# Altium project Main_board3.PrjPcb
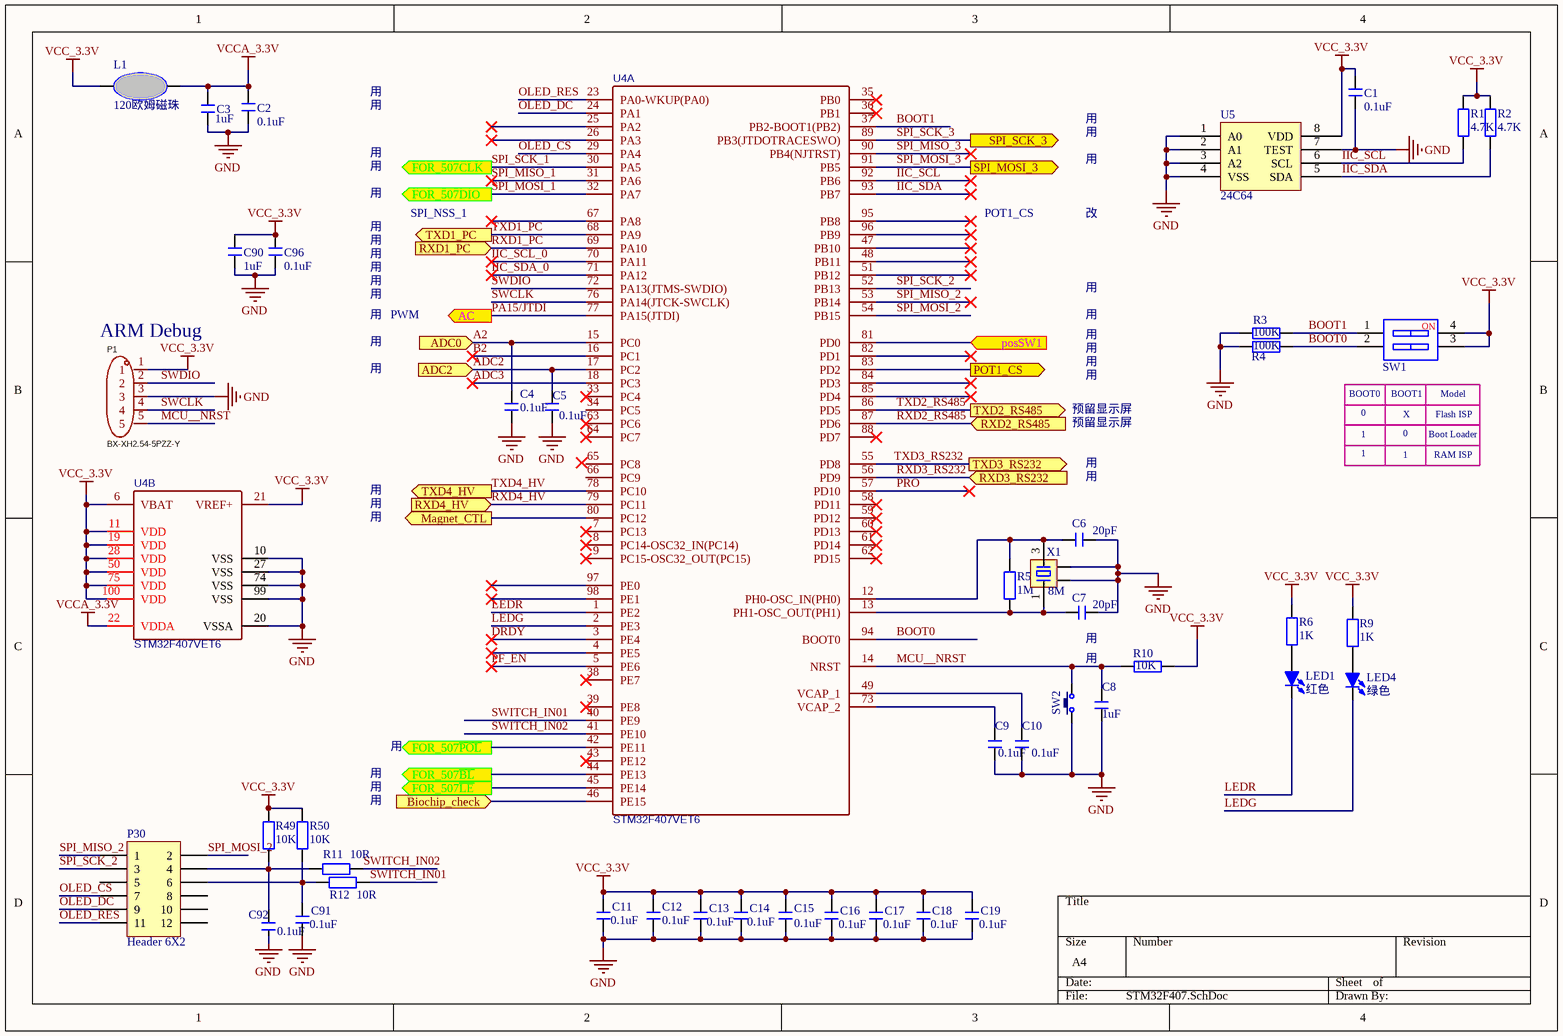
[diagram p0: STM32F407.SchDoc]
2 sheets, 64 parts. Net scope: flat (ports and power ports of the same name join across sheets).
Board file: BD3_yd_V1.0.PcbDoc
Sheets:
  STM32F407.SchDoc
  Connect.SchDoc

## Sheet STM32F407.SchDoc
size A4

### Parts
C1  0.1uF  [C 0603]
C2  0.1uF  [C 0603]
C3  1uF  [C 0603]
C4  0.1uF  [C 0603]
C5  0.1uF  [C 0603]
C6  20pF  [C 0603]
C7  20pF  [C 0603]
C8  1uF  [C 0603]
C9  0.1uF  [C 0603]
C10  0.1uF  [C 0603]
C11  0.1uF  [C 0603]
C12  0.1uF  [C 0603]
C13  0.1uF  [C 0603]
C14  0.1uF  [C 0603]
C15  0.1uF  [C 0603]
C16  0.1uF  [C 0603]
C17  0.1uF  [C 0603]
C18  0.1uF  [C 0603]
C19  0.1uF  [C 0603]
C90  1uF  [C 0603]
C91  0.1uF  [C 0603]
C92  0.1uF  [C 0603]
C96  0.1uF  [C 0603]
L1  120欧姆磁珠  [L 0603]
LED1  红色  [LED 0603R]
LED4  绿色  [LED 0603G]
P1  BX-XH2.54-5PZZ-Y  [CONN-TH_BX-XH2.54-5PZZ-Y]
P30  Header 6X2  [HDR-6X2]
R1  4.7K  [R 0603]
R2  4.7K  [R 0603]
R3  100K  [R 0603]
R4  100K  [R 0603]
R5  1M  [R 0603]
R6  1K  [R 0603]
R9  1K  [R 0603]
R10  10K  [R 0603]
R11  10R  [R 0603]
R12  10R  [R 0603]
R49  10K  [R 0603]
R50  10K  [R 0603]
SW1  CSW-2P  [CSW1.27 SMD-2P]  (value not drawn)
SW2  3x6x5  [TSW SMD-3*6*2.5]  (value not drawn)
U4  STM32F407VET6  [LQFP100 14x14_N]  (parts A,B of 2)
U5  24C64  [SOP8_N]
X1  8M  [XTAL-3225]

### Ports
AC (out), ADC0 (in), ADC2 (in), Biochip_check (in), FOR_507CLK (out), FOR_507DIO (out), FOR_507~{BL} (out), FOR_507~{LE} (out), FOR_507~{POL} (out), Magnet_CTL (out), posSW1 (in), POT1_CS (out), RXD1_PC (in), RXD2_RS485 (in), RXD3_RS232 (in), RXD4_HV (in), SPI_MOSI_3 (out), SPI_SCK_3 (out), TXD1_PC (out), TXD2_RS485 (out), TXD3_RS232 (out), TXD4_HV (out)

### Nets
GND: C1.1 C2.1 C3.1 C4.1 C5.1 C6.1 C7.1 C8.1 C9.1 C10.1 C11.1 C12.1 C13.1 C14.1 C15.1 C16.1 C17.1 C18.1 C19.1 C90.2 C91.1 C92.1 C96.2 P1.3 R3.2 R4.2 SW2.1 U4.10(VSS) U4.20(VSSA) U4.27(VSS) U4.74(VSS) U4.99(VSS) U5.1(A0) U5.2(A1) U5.3(A2) U5.4(VSS) U5.7(TEST) X1.2 X1.4
VCC_3.3V: C1.2 C11.2 C12.2 C13.2 C14.2 C15.2 C16.2 C17.2 C18.2 C19.2 C90.1 C96.1 L1.1 P1.1 R1.1 R2.1 R6.1 R9.1 R10.1 R49.1 R50.2 SW1.3 SW1.4 U4.6(VBAT) U4.11(VDD) U4.19(VDD) U4.21(VREF+) U4.28(VDD) U4.50(VDD) U4.75(VDD) U4.100(VDD) U5.8(VDD)
VCCA_3.3V: C2.2 C3.2 L1.2 U4.22(VDDA)
A2: C4.2 U4.15(PC0) ; port ADC0
ADC2: C5.2 U4.17(PC2) ; port ADC2
ADC3: U4.18(PC3)
B2: U4.16(PC1)
BOOT0: R4.1 SW1.2 U4.94(BOOT0)
BOOT1: R3.1 SW1.1 U4.37(PB2-BOOT1(PB2))
DRDY: U4.3(PE4)
IIC_SCL: R1.2 U4.92(PB6) U5.6(SCL)
IIC_SCL_0: U4.70(PA11)
IIC_SDA: R2.2 U4.93(PB7) U5.5(SDA)
IIC_SDA_0: U4.71(PA12)
LEDG: LED4.2(K) U4.2(PE3)
LEDR: LED1.2(K) U4.1(PE2)
MCU＿NRST: C8.2 P1.5 R10.2 SW2.2 U4.14(NRST)
OLED_CS: P30.7 U4.29(PA4)
OLED_DC: P30.9 U4.24(PA1)
OLED_RES: P30.11 U4.23(PA0-WKUP(PA0))
PA15/JTDI: U4.77(PA15(JTDI)) ; port AC
PF_EN: U4.5(PE6)
PRO: U4.57(PD10)
RXD1_PC: U4.69(PA10) ; port RXD1_PC
RXD2_RS485: U4.87(PD6) ; port RXD2_RS485
RXD3_RS232: U4.56(PD9) ; port RXD3_RS232
RXD4_HV: U4.79(PC11) ; port RXD4_HV
SPI_MISO_1: U4.31(PA6)
SPI_MISO_2: P30.1 U4.53(PB14)
SPI_MISO_3: U4.90(PB4(NJTRST))
SPI_MOSI_1: U4.32(PA7) ; port FOR_507DIO
SPI_MOSI_2: P30.2 U4.54(PB15)
SPI_MOSI_3: U4.91(PB5) ; port SPI_MOSI_3
SPI_SCK_1: U4.30(PA5) ; port FOR_507CLK
SPI_SCK_2: P30.3 U4.52(PB13)
SPI_SCK_3: U4.89(PB3(JTDOTRACESWO)) ; port SPI_SCK_3
SWCLK: P1.4 U4.76(PA14(JTCK-SWCLK))
SWDIO: P1.2 U4.72(PA13(JTMS-SWDIO))
SWITCH_IN01: R12.2 U4.40(PE9)
SWITCH_IN02: R11.2 U4.41(PE10)
TXD1_PC: U4.68(PA9) ; port TXD1_PC
TXD2_RS485: U4.86(PD5) ; port TXD2_RS485
TXD3_RS232: U4.55(PD8) ; port TXD3_RS232
TXD4_HV: U4.78(PC10) ; port TXD4_HV
NetC6_2: C6.2 R5.1 U4.12(PH0-OSC_IN(PH0)) X1.3
NetC7_2: C7.2 R5.2 U4.13(PH1-OSC_OUT(PH1)) X1.1
NetC9_2: C9.2 U4.73(VCAP_2)
NetC10_2: C10.2 U4.49(VCAP_1)
NetC91_2: C91.2 P30.6 R12.1 R50.1
NetC92_2: C92.2 P30.4 R11.1 R49.2
NetLED1_1: LED1.1(A) R6.2
NetLED4_1: LED4.1(A) R9.2
NetP10_1: U4.83(PD2) ; port POT1_CS
NetP10_3: U4.80(PC12) ; port Magnet_CTL
NetP11_7: U4.46(PE15) ; port Biochip_check
NetP11_8: U4.42(PE11) ; port FOR_507~{POL}
NetP11_10: U4.44(PE13) ; port FOR_507~{BL}
NetP11_12: U4.45(PE14) ; port FOR_507~{LE}
NetR40_2: U4.81(PD0) ; port posSW1

Not connected (* = marked no-connect by the designer): P30 5 8 10 12; U4 4(PE5)* 7(PC13)* 8(PC14-OSC32_IN(PC14))* 9(PC15-OSC32_OUT(PC15))* 25(PA2)* 26(PA3)* 33(PC4)* 34(PC5) 35(PB0)* 36(PB1)* 38(PE7)* 39(PE8)* 43(PE12)* 47(PB10)* 48(PB11)* 51(PB12)* 58(PD11)* 59(PD12)* 60(PD13)* 61(PD14)* 62(PD15)* 63(PC6)* 64(PC7)* 65(PC8) 66(PC9) 67(PA8)* 82(PD1)* 84(PD3)* 85(PD4)* 88(PD7)* 95(PB8)* 96(PB9)* 97(PE0)* 98(PE1)*

### Notes on the sheet
- 用
- SPI_NSS_1
- POT1_CS
- 改
- (near P1) ARM Debug
- PWM
- 预留显示屏
- (near SW1) BOOT0
- 0
- 1
- (near SW1) BOOT1
- X
- Boot Loader
- Flash ISP
- (near SW1) Model
- RAM ISP
- (near C7) 用
- (in symbol CSW-2P) NO

### Library data of the parts
C1-C19 C91 C92 = C: 无极性贴片电容; 版权归属: 源创客; BOM名称: 无极性贴片电容; 学习资源: www.ooocke.com
C90 C96 = C-CC: 直插瓷片电容; 版权归属: 源创客; BOM名称: 直插瓷片电容; 学习资源: www.ooocke.com
L1 = FERRITBEAD
LED1 LED4 = LED-SMD: 贴片LED; 版权归属: 源创客; BOM名称: 贴片LED; 学习资源: www.ooocke.com
P1 = BX-XH2.54-5PZZ-Y: Add into BOM: yes; Pins Structure: 1x5P; Pitch: 2.54mm; Reference Series: XH; Number of PINs Per Row: 5; Rated Voltage (Max): 250V; Plastic Material: PA66; Symbol: BX-XH2.54-5PZZ-Y; Device: BX-XH2.54-5PZZ-Y; Supplier Part: C22388511; Manufacturer Part: BX-XH2.54-5PZZ-Y; JLCPCB Part Class: Extended Part; Datasheet: https://atta.szlcsc.com/upload/public/pdf/source/20240429/3EA06438A1F774359BF6390646FD240A.pdf; Supplier: LCSC; Convert to PCB: yes; Number of Pins: 5P; Number of Rows: 1
P30 = Header 6X2: Header, 6-Pin, Dual row; LatestRevisionDate: 17-Jul-2002; LatestRevisionNote: Re-released for DXP Platform.; Publisher: Altium Limited
R1-R6 R9-R12 R49 R50 = R: 贴片电阻; 版权归属: 源创客; BOM名称: 贴片电阻; 学习资源: www.ooocke.com
SW1 = CSW-2P: 2路编码开关; 版权归属: 源创客; BOM名称: 2路编码开关; 学习资源: www.ooocke.com
SW2 = TSW 3x6: 3x6轻触开关; 版权归属: 源创客; BOM名称: 3x6轻触开关; 学习资源: www.ooocke.com
U4 = STM32F407VET6: BOM_Manufacturer: ST; subpart_no: 1; tags: STM32; BOM_Supplier Part: C28730; BOM_Supplier: LCSC; BOM_Manufacturer Part: STM32F407VET6; image: http://image.lceda.cn/szlcsc/C28730.jpg; BOM_JLCPCB Part Class: Extended Part; spicePre: U; spiceSymbolName: STM32F407VET6
U5 = 24LC02
X1 = XTAL-4: 4脚晶振; 版权归属: 源创客; BOM名称: 4脚晶振; 学习资源: www.ooocke.com

## Sheet Connect.SchDoc
size A4
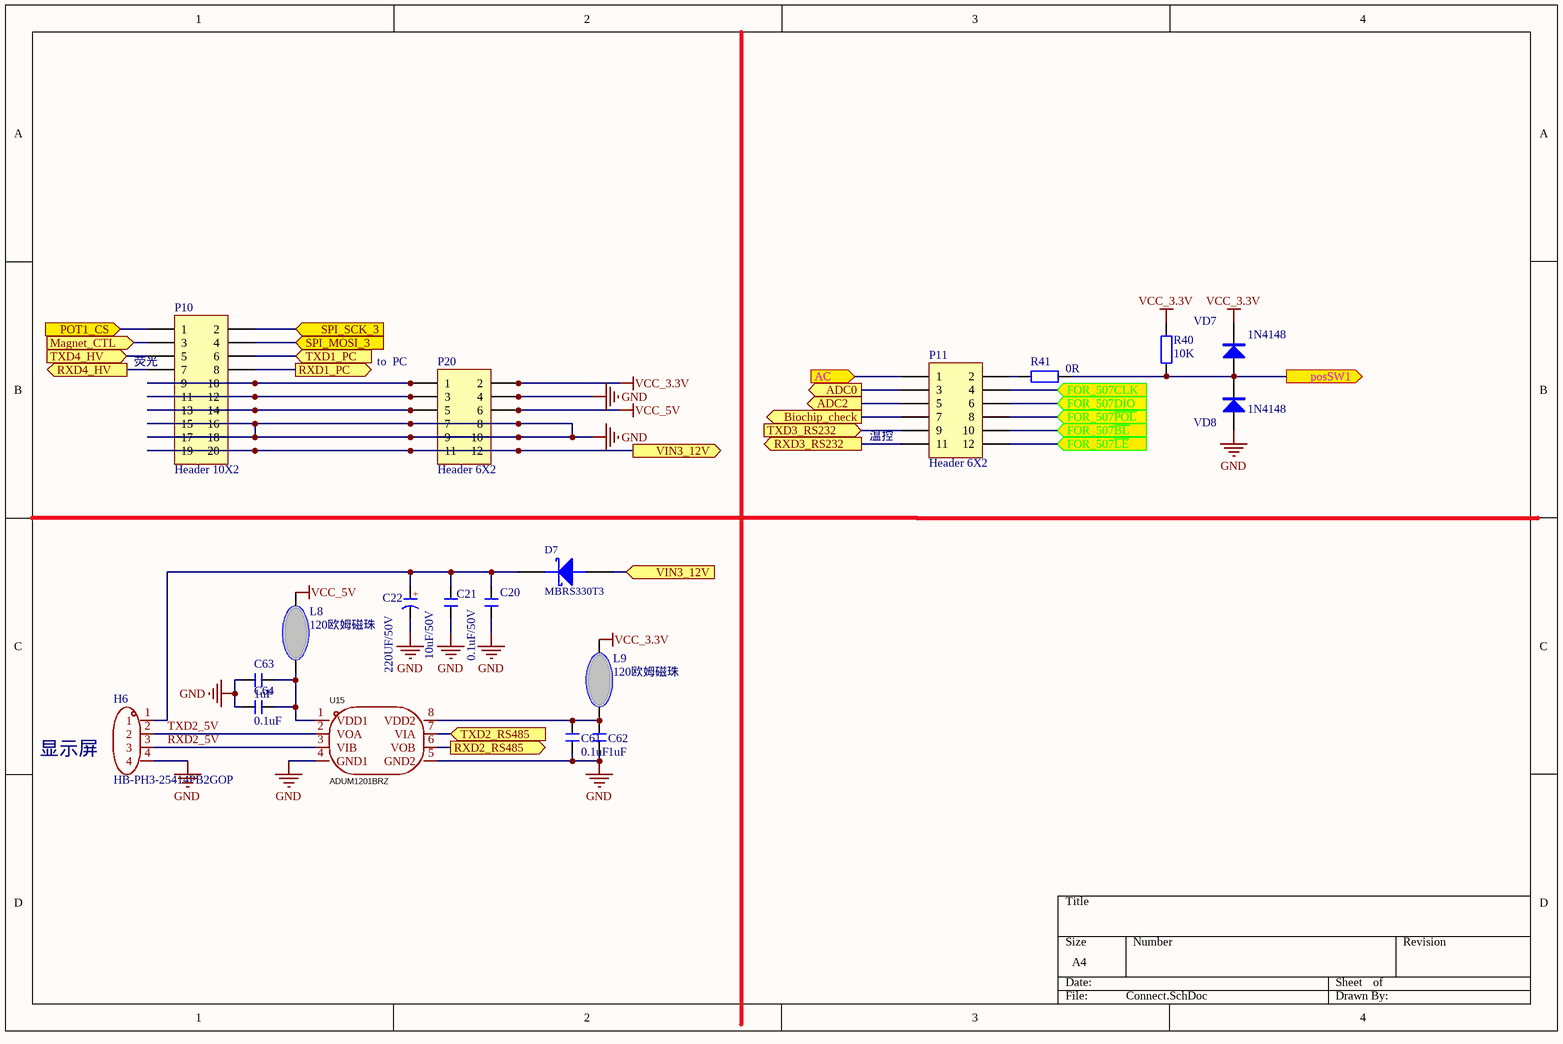
[diagram p1: Connect.SchDoc]

### Parts
C20  0.1uF/50V  [C 1206]
C21  10uF/50V  [C 1206]
C22  220UF/50V  [CAP 5.0*10*12.5]
C61  0.1uF  [C 0603]
C62  1uF  [C 0603]
C63  1uF  [C 0603]
C64  0.1uF  [C 0603]
D7  MBRS330T3  [MBRS340]
H6  HB-PH3-25414PB2GOP  [CONN-TH_4P-P2.50_ZX-XH2.54-4PZZ-Y]
L8  120欧姆磁珠  [L 0603]
L9  120欧姆磁珠  [L 0603]
P10  Header 10X2  [HDR-10X2]
P11  Header 6X2  [HDR-6X2]
P20  Header 6X2  [HDR-6X2]
R40  10K  [R 0603]
R41  0R  [R 0603]
U15  ADUM1201BRZ  [SOIC-8_L4.9-W3.9-P1.27-LS6.0-BL]
VD7  1N4148  [SOD-323]
VD8  1N4148  [SOD-323]

### Ports
AC (in), ADC0 (out), ADC2 (out), Biochip_check (out), FOR_507CLK (in), FOR_507DIO (in), FOR_507~{BL} (in), FOR_507~{LE} (in), FOR_507~{POL} (in), Magnet_CTL (in), posSW1 (out), POT1_CS (in), RXD1_PC (out), RXD2_RS485 (out), RXD3_RS232 (out), RXD4_HV (out), SPI_MOSI_3 (in), SPI_SCK_3 (in), TXD1_PC (in), TXD2_RS485 (in), TXD3_RS232 (in), TXD4_HV (in), VIN3_12V (in), VIN3_12V (out)

### Nets
GND: C20.1 C21.1 C22.2 C61.2 C62.2 C63.2 C64.2 H6.4 P10.11 P10.12 P10.15 P10.16 P10.17 P10.18 P20.3 P20.4 P20.7 P20.8 P20.9 P20.10 U15.4(GND1) U15.5(GND2) VD8.1(A)
VCC_3.3V: L9.2 P10.9 P10.10 P20.1 P20.2 R40.1 VD7.2(K)
VCC_5V: L8.1 P10.13 P10.14 P20.5 P20.6
A2: P11.3 ; port ADC0
ADC2: P11.5 ; port ADC2
PA15/JTDI: P11.1 ; port AC
RXD1_PC: P10.8 ; port RXD1_PC
RXD2_5V: H6.3 U15.3(VIB)
RXD2_RS485: U15.6(VOB) ; port RXD2_RS485
RXD3_RS232: P11.11 ; port RXD3_RS232
RXD4_HV: P10.7 ; port RXD4_HV
SPI_MOSI_1: P11.6 ; port FOR_507DIO
SPI_MOSI_3: P10.4 ; port SPI_MOSI_3
SPI_SCK_1: P11.4 ; port FOR_507CLK
SPI_SCK_3: P10.2 ; port SPI_SCK_3
TXD1_PC: P10.6 ; port TXD1_PC
TXD2_5V: H6.2 U15.2(VOA)
TXD2_RS485: U15.7(VIA) ; port TXD2_RS485
TXD3_RS232: P11.9 ; port TXD3_RS232
TXD4_HV: P10.5 ; port TXD4_HV
NetC20_2: C20.2 C21.2 C22.1 D7.2(K) H6.1
NetC61_1: C61.1 C62.1 L9.1 U15.8(VDD2)
NetC63_1: C63.1 C64.1 L8.2 U15.1(VDD1)
NetD7_1: D7.1(A) P10.19 P10.20 P20.11 P20.12 ; port VIN3_12V
NetP10_1: P10.1 ; port POT1_CS
NetP10_3: P10.3 ; port Magnet_CTL
NetP11_2: P11.2 R41.2
NetP11_7: P11.7 ; port Biochip_check
NetP11_8: P11.8 ; port FOR_507~{POL}
NetP11_10: P11.10 ; port FOR_507~{BL}
NetP11_12: P11.12 ; port FOR_507~{LE}
NetR40_2: R40.2 R41.1 VD7.1(A) VD8.2(K) ; port posSW1

### Notes on the sheet
- (near P10) 荧光
- (near P20) to  PC
- (near P11) 温控
- 显示屏

### Library data of the parts
C20 C21 = C: 无极性贴片电容; 版权归属: 源创客; BOM名称: 无极性贴片电容; 学习资源: www.ooocke.com
C22 = C-CAP: 直插电解电容; 版权归属: 源创客; BOM名称: 直插电解电容; 学习资源: www.ooocke.com
C61-C64 = C-CC: 直插瓷片电容; 版权归属: 源创客; BOM名称: 直插瓷片电容; 学习资源: www.ooocke.com
D7 = DIODE SCHOTTKY: Schottky Diode
H6 = HB-PH3-25414PB2GOP: Add into BOM: yes; Pin Structure: 1x4P; Pitch: 2.54mm; Current Rating (Max): 3A; Voltage Rating (Max): 250V; Symbol: HB-PH3-25414PB2GOP; Device: HB-PH3-25414PB2GOP; Supplier Part: C6332197; Manufacturer Part: HB-PH3-25414PB2GOP; Datasheet: https://atta.szlcsc.com/upload/public/pdf/source/20230803/F72D259687963761DF1B552F3BB84A31.pdf; Supplier: LCSC; Convert to PCB: yes; Row Spacing: 2.54mm; Number of Pins: 4P; Length of Mating Pin: 6mm; Insulation Height: 2.54mm; Length of End Connection Pin: 3mm; Comment_1: HB-PH3-25414PB2GOP
L8 L9 = FERRITBEAD
P10 = Header 10X2: Header, 10-Pin, Dual row; LatestRevisionDate: 17-Jul-2002; LatestRevisionNote: Re-released for DXP Platform.; Publisher: Altium Limited
P11 P20 = Header 6X2: Header, 6-Pin, Dual row; LatestRevisionDate: 17-Jul-2002; LatestRevisionNote: Re-released for DXP Platform.; Publisher: Altium Limited
R40 R41 = R: 贴片电阻; 版权归属: 源创客; BOM名称: 贴片电阻; 学习资源: www.ooocke.com
U15 = ADUM1201BRZ: Add into BOM: yes; Number of Forward Channels: 1; Data Rate(Max): 10Mbps; Isolation Voltage(Vrms): 2500; Symbol: ADUM1201BRZ; Device: ADUM1201BRZ; Supplier Part: C579376; Manufacturer Part: ADUM1201BRZ; Supplier Footprint: SOIC-8; JLCPCB Part Class: Extended Part; Datasheet: https://atta.szlcsc.com/upload/public/pdf/source/20190717/C404334_2B93F55860F1199D4BB807185B15482E.pdf; Supplier: LCSC; Convert to PCB: yes; Number of Reverse Channels: 1
VD7 VD8 = 1N4148: 高速开关二极管; 版权归属: 源创客; BOM名称: 高速开关二极管; 学习资源: www.ooocke.com

## Nets that join several sheets
GND: STM32F407 (39 pins), Connect (23 pins)
VCC_3.3V: STM32F407 (32 pins), Connect (7 pins)
A2: STM32F407 (C4.2 U4.15), Connect (P11.3)
ADC2: STM32F407 (C5.2 U4.17), Connect (P11.5)
NetP10_1: STM32F407 (U4.83), Connect (P10.1)
NetP10_3: STM32F407 (U4.80), Connect (P10.3)
NetP11_7: STM32F407 (U4.46), Connect (P11.7)
NetP11_8: STM32F407 (U4.42), Connect (P11.8)
NetP11_10: STM32F407 (U4.44), Connect (P11.10)
NetP11_12: STM32F407 (U4.45), Connect (P11.12)
NetR40_2: STM32F407 (U4.81), Connect (R40.2 R41.1 VD7.1 VD8.2)
PA15/JTDI: STM32F407 (U4.77), Connect (P11.1)
RXD1_PC: STM32F407 (U4.69), Connect (P10.8)
RXD2_RS485: STM32F407 (U4.87), Connect (U15.6)
RXD3_RS232: STM32F407 (U4.56), Connect (P11.11)
RXD4_HV: STM32F407 (U4.79), Connect (P10.7)
SPI_MOSI_1: STM32F407 (U4.32), Connect (P11.6)
SPI_MOSI_3: STM32F407 (U4.91), Connect (P10.4)
SPI_SCK_1: STM32F407 (U4.30), Connect (P11.4)
SPI_SCK_3: STM32F407 (U4.89), Connect (P10.2)
TXD1_PC: STM32F407 (U4.68), Connect (P10.6)
TXD2_RS485: STM32F407 (U4.86), Connect (U15.7)
TXD3_RS232: STM32F407 (U4.55), Connect (P11.9)
TXD4_HV: STM32F407 (U4.78), Connect (P10.5)